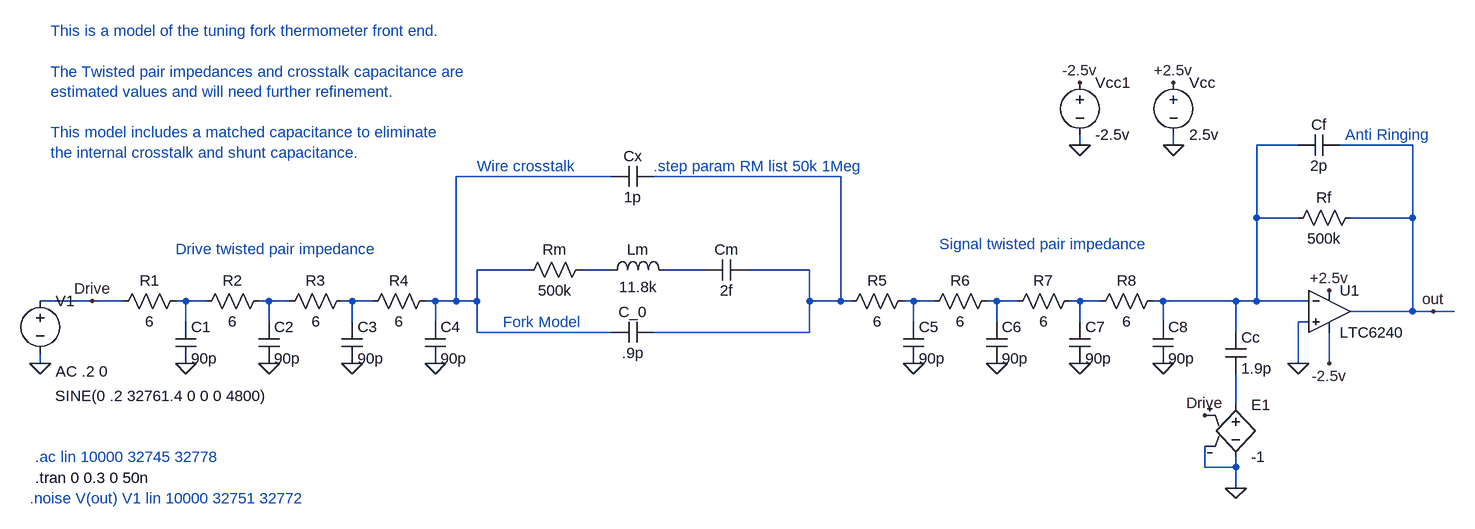
[diagram p0: schematic TuningFork_FrontEndNoise_Model.asc]
TuningFork_FrontEndNoise_Model.asc, the LTspice schematic file:
Version 4.1
SHEET 1 2832 680
WIRE 1840 -96 1840 -112
WIRE 1984 -96 1984 -112
WIRE 2176 -96 2112 -96
WIRE 2352 -96 2240 -96
WIRE 1120 -48 880 -48
WIRE 1472 -48 1184 -48
WIRE 2112 16 2112 -96
WIRE 2176 16 2112 16
WIRE 2352 16 2352 -96
WIRE 2352 16 2256 16
WIRE 992 96 912 96
WIRE 1120 96 1072 96
WIRE 1264 96 1200 96
WIRE 1424 96 1328 96
WIRE 320 144 240 144
WIRE 368 144 320 144
WIRE 464 144 448 144
WIRE 496 144 464 144
WIRE 592 144 576 144
WIRE 624 144 592 144
WIRE 720 144 704 144
WIRE 752 144 720 144
WIRE 848 144 832 144
WIRE 880 144 880 -48
WIRE 880 144 848 144
WIRE 912 144 912 96
WIRE 912 144 880 144
WIRE 1424 144 1424 96
WIRE 1472 144 1472 -48
WIRE 1472 144 1424 144
WIRE 1488 144 1472 144
WIRE 1584 144 1568 144
WIRE 1616 144 1584 144
WIRE 1712 144 1696 144
WIRE 1744 144 1712 144
WIRE 1840 144 1824 144
WIRE 1872 144 1840 144
WIRE 1968 144 1952 144
WIRE 2080 144 1968 144
WIRE 2112 144 2112 16
WIRE 2112 144 2080 144
WIRE 2192 144 2112 144
WIRE 2352 160 2352 16
WIRE 2352 160 2256 160
WIRE 2384 160 2352 160
WIRE 2416 160 2384 160
WIRE 464 176 464 144
WIRE 592 176 592 144
WIRE 720 176 720 144
WIRE 848 176 848 144
WIRE 1584 176 1584 144
WIRE 1712 176 1712 144
WIRE 1840 176 1840 144
WIRE 1968 176 1968 144
WIRE 2192 176 2176 176
WIRE 912 192 912 144
WIRE 1120 192 912 192
WIRE 1424 192 1424 144
WIRE 1424 192 1184 192
WIRE 2080 192 2080 144
WIRE 240 240 240 224
WIRE 2176 240 2176 176
WIRE 2224 240 2224 192
WIRE 2080 304 2080 256
WIRE 2032 400 2032 368
WIRE 2080 400 2080 384
WIRE 2080 400 2032 400
WIRE 2080 432 2080 400
FLAG 1984 -192 +2.5v
FLAG 2176 240 0
FLAG 240 240 0
FLAG 1984 -96 0
FLAG 1840 -192 -2.5v
FLAG 1840 -96 0
FLAG 2224 240 -2.5v
FLAG 2224 128 +2.5v
FLAG 464 240 0
FLAG 592 240 0
FLAG 720 240 0
FLAG 848 240 0
FLAG 1584 240 0
FLAG 1712 240 0
FLAG 1840 240 0
FLAG 1968 240 0
FLAG 320 144 Drive
FLAG 2032 320 Drive
FLAG 2080 432 0
FLAG 2384 160 out
SYMBOL voltage 240 128 R0
WINDOW 123 24 124 Left 2
WINDOW 39 0 0 Left 0
WINDOW 3 23 162 Left 2
SYMATTR Value2 AC .2 0
SYMATTR InstName V1
SYMATTR Value SINE(0 .2 32761.4 0 0 0 4800)
SYMBOL res 1088 80 R90
WINDOW 0 0 56 VBottom 2
WINDOW 3 32 56 VTop 2
SYMATTR InstName Rm
SYMATTR Value 500k
SYMBOL ind 1104 112 R270
WINDOW 0 32 56 VTop 2
WINDOW 3 5 56 VBottom 2
SYMATTR InstName Lm
SYMATTR Value 11.8k
SYMATTR SpiceLine Rser=1m
SYMBOL cap 1328 80 R90
WINDOW 0 0 32 VBottom 2
WINDOW 3 32 32 VTop 2
SYMATTR InstName Cm
SYMATTR Value 2f
SYMBOL cap 1120 208 R270
WINDOW 0 32 32 VTop 2
WINDOW 3 0 32 VBottom 2
SYMATTR InstName C_0
SYMATTR Value .9p
SYMBOL voltage 1984 -208 R0
WINDOW 123 0 0 Left 0
WINDOW 39 0 0 Left 0
SYMATTR InstName Vcc
SYMATTR Value 2.5v
SYMBOL OpAmps\\LTC6240 2224 160 R0
SYMATTR InstName U1
SYMBOL res 2272 0 R90
WINDOW 0 0 56 VBottom 2
WINDOW 3 32 56 VTop 2
SYMATTR InstName Rf
SYMATTR Value 500k
SYMBOL voltage 1840 -208 R0
WINDOW 123 0 0 Left 0
WINDOW 39 0 0 Left 0
SYMATTR InstName Vcc1
SYMATTR Value -2.5v
SYMBOL res 464 128 R90
WINDOW 0 0 56 VBottom 2
WINDOW 3 32 56 VTop 2
SYMATTR InstName R1
SYMATTR Value 6
SYMBOL res 592 128 R90
WINDOW 0 0 56 VBottom 2
WINDOW 3 32 56 VTop 2
SYMATTR InstName R2
SYMATTR Value 6
SYMBOL res 720 128 R90
WINDOW 0 0 56 VBottom 2
WINDOW 3 32 56 VTop 2
SYMATTR InstName R3
SYMATTR Value 6
SYMBOL res 848 128 R90
WINDOW 0 0 56 VBottom 2
WINDOW 3 32 56 VTop 2
SYMATTR InstName R4
SYMATTR Value 6
SYMBOL cap 448 176 R0
SYMATTR InstName C1
SYMATTR Value 90p
SYMBOL cap 576 176 R0
SYMATTR InstName C2
SYMATTR Value 90p
SYMBOL cap 704 176 R0
SYMATTR InstName C3
SYMATTR Value 90p
SYMBOL cap 832 176 R0
SYMATTR InstName C4
SYMATTR Value 90p
SYMBOL res 1584 128 R90
WINDOW 0 0 56 VBottom 2
WINDOW 3 32 56 VTop 2
SYMATTR InstName R5
SYMATTR Value 6
SYMBOL res 1712 128 R90
WINDOW 0 0 56 VBottom 2
WINDOW 3 32 56 VTop 2
SYMATTR InstName R6
SYMATTR Value 6
SYMBOL res 1840 128 R90
WINDOW 0 0 56 VBottom 2
WINDOW 3 32 56 VTop 2
SYMATTR InstName R7
SYMATTR Value 6
SYMBOL res 1968 128 R90
WINDOW 0 0 56 VBottom 2
WINDOW 3 32 56 VTop 2
SYMATTR InstName R8
SYMATTR Value 6
SYMBOL cap 1568 176 R0
SYMATTR InstName C5
SYMATTR Value 90p
SYMBOL cap 1696 176 R0
SYMATTR InstName C6
SYMATTR Value 90p
SYMBOL cap 1824 176 R0
SYMATTR InstName C7
SYMATTR Value 90p
SYMBOL cap 1952 176 R0
SYMATTR InstName C8
SYMATTR Value 90p
SYMBOL cap 1184 -64 R90
WINDOW 0 0 32 VBottom 2
WINDOW 3 32 32 VTop 2
SYMATTR InstName Cx
SYMATTR Value 1p
SYMBOL cap 2240 -112 R90
WINDOW 0 0 32 VBottom 2
WINDOW 3 32 32 VTop 2
SYMATTR InstName Cf
SYMATTR Value 2p
SYMBOL e 2080 288 R0
SYMATTR InstName E1
SYMATTR Value -1
SYMBOL cap 2064 192 R0
SYMATTR InstName Cc
SYMATTR Value 1.9p
TEXT 912 -64 Left 2 ;Wire crosstalk
TEXT 2248 -112 Left 2 ;Anti Ringing
TEXT 448 64 Left 2 ;Drive twisted pair impedance
TEXT 1624 56 Left 2 ;Signal twisted pair impedance
TEXT 952 176 Left 2 ;Fork Model
TEXT 256 -272 Left 2 ;This is a model of the tuning fork thermometer front end.\n \nThe Twisted pair impedances and crosstalk capacitance are \nestimated values and will need further refinement.\n \nThis model includes a matched capacitance to eliminate \nthe internal crosstalk and shunt capacitance.
TEXT 1184 -64 Left 2 ;.step param RM list 50k 1Meg
TEXT 232 384 Left 2 ;.ac lin 10000 32745 32778
TEXT 224 448 Left 2 ;.noise V(out) V1 lin 10000 32751 32772
TEXT 232 416 Left 2 !.tran 0 0.3 0 50n

The netlist it stands for:
* TuningFork_FrontEndNoise_Model.asc
V1 Drive 0 SINE(0 .2 32761.4 0 0 0 4800) AC .2 0
Rm N004 N002 500k
Lm N004 N005 11.8k Rser=1m
Cm N003 N005 2f
C_0 N002 N003 .9p
Vcc +2.5v 0 2.5v
* U1: LTC6240 (symbol OpAmps\LTC6240 not available, pins judged from their places): In+=0 In-=N001 V+=+2.5v V-=-2.5v OUT=out
Rf out N001 500k
Vcc1 -2.5v 0 -2.5v
R1 N006 Drive 6
R2 N007 N006 6
R3 N008 N007 6
R4 N002 N008 6
C1 N006 0 90p
C2 N007 0 90p
C3 N008 0 90p
C4 N002 0 90p
R5 N009 N003 6
R6 N010 N009 6
R7 N011 N010 6
R8 N001 N011 6
C5 N009 0 90p
C6 N010 0 90p
C7 N011 0 90p
C8 N001 0 90p
Cx N003 N002 1p
Cf out N001 2p
E1 N012 0 Drive 0 -1
Cc N001 N012 1.9p
* Wire crosstalk
* Anti Ringing
* Drive twisted pair impedance
* Signal twisted pair impedance
* Fork Model
* This is a model of the tuning fork thermometer front end.
* The Twisted pair impedances and crosstalk capacitance are
* estimated values and will need further refinement.
* This model includes a matched capacitance to eliminate
* the internal crosstalk and shunt capacitance.
* .step param RM list 50k 1Meg
* .ac lin 10000 32745 32778
* .noise V(out) V1 lin 10000 32751 32772
.tran 0 0.3 0 50n
.backanno
.end